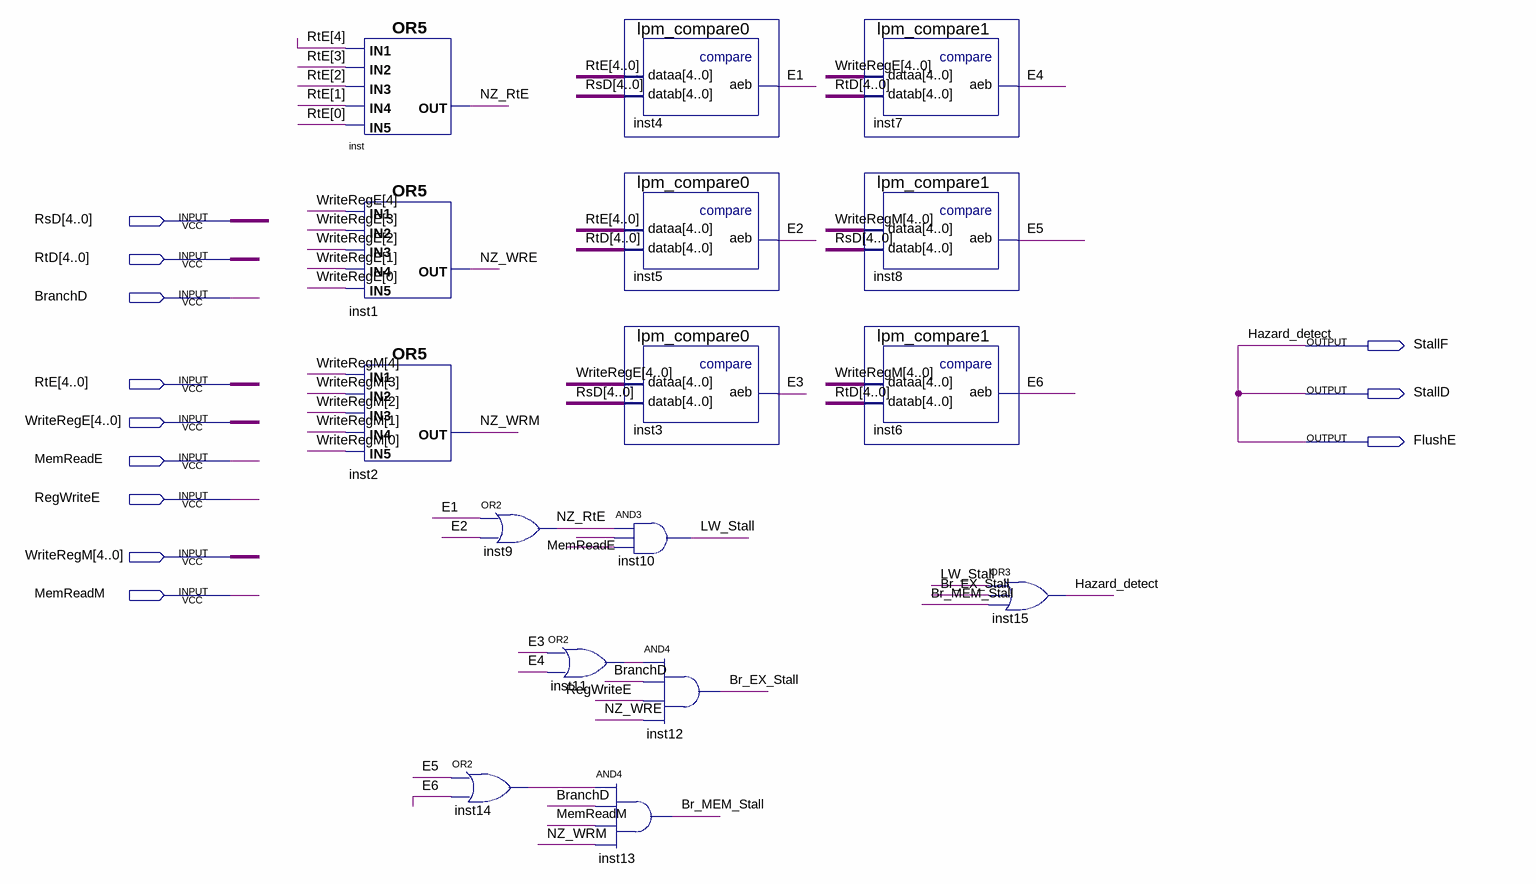
[diagram p0: schematic sheet]
// Quartus schematic Hazard_detection_unit.bdf as structural Verilog: 16 symbols, 12 pins
module Hazard_detection_unit (
  input  [4:0] RsD,
  input  [4:0] RtD,
  input  BranchD,
  input  [4:0] RtE,
  input  [4:0] WriteRegE,
  input  MemReadE,
  input  RegWriteE,
  input  [4:0] WriteRegM,
  input  MemReadM,
  output StallF,
  output StallD,
  output FlushE
);

  wire Br_EX_Stall, Br_MEM_Stall, E1, E2, E3, E4, E5, E6, inst9_out, inst11_out, inst14_out, LW_Stall,
       NZ_RtE, NZ_WRE, NZ_WRM;

  or inst (NZ_RtE, RtE[4], RtE[3], RtE[2], RtE[1], RtE[0]);
  or inst1 (NZ_WRE, WriteRegE[4], WriteRegE[3], WriteRegE[2], WriteRegE[1], WriteRegE[0]);
  or inst2 (NZ_WRM, WriteRegM[4], WriteRegM[3], WriteRegM[2], WriteRegM[1], WriteRegM[0]);
  or inst9 (inst9_out, E1, E2);
  or inst14 (inst14_out, E5, E6);
  or inst11 (inst11_out, E3, E4);
  lpm_compare0 inst4 (.dataa(RtE), .datab(RsD), .aeb(E1));
  lpm_compare0 inst5 (.dataa(RtE), .datab(RtD), .aeb(E2));
  lpm_compare0 inst3 (.dataa(WriteRegE), .datab(RsD), .aeb(E3));
  and inst10 (LW_Stall, inst9_out, NZ_RtE, MemReadE);
  and inst12 (Br_EX_Stall, inst11_out, BranchD, RegWriteE, NZ_WRE);
  and inst13 (Br_MEM_Stall, inst14_out, BranchD, MemReadM, NZ_WRM);
  lpm_compare1 inst7 (.dataa(WriteRegE), .datab(RtD), .aeb(E4));
  lpm_compare1 inst8 (.dataa(WriteRegM), .datab(RsD), .aeb(E5));
  lpm_compare1 inst6 (.dataa(WriteRegM), .datab(RtD), .aeb(E6));
  or inst15 (FlushE, LW_Stall, Br_EX_Stall, Br_MEM_Stall);

  assign StallD = FlushE;
  assign StallF = FlushE;

  // Other names for the same wires on the sheet: Hazard_detect = FlushE
endmodule
